# Altium schematic sheet Output.SchDoc
size A; SheetNumber: 9; SheetTotal: 9
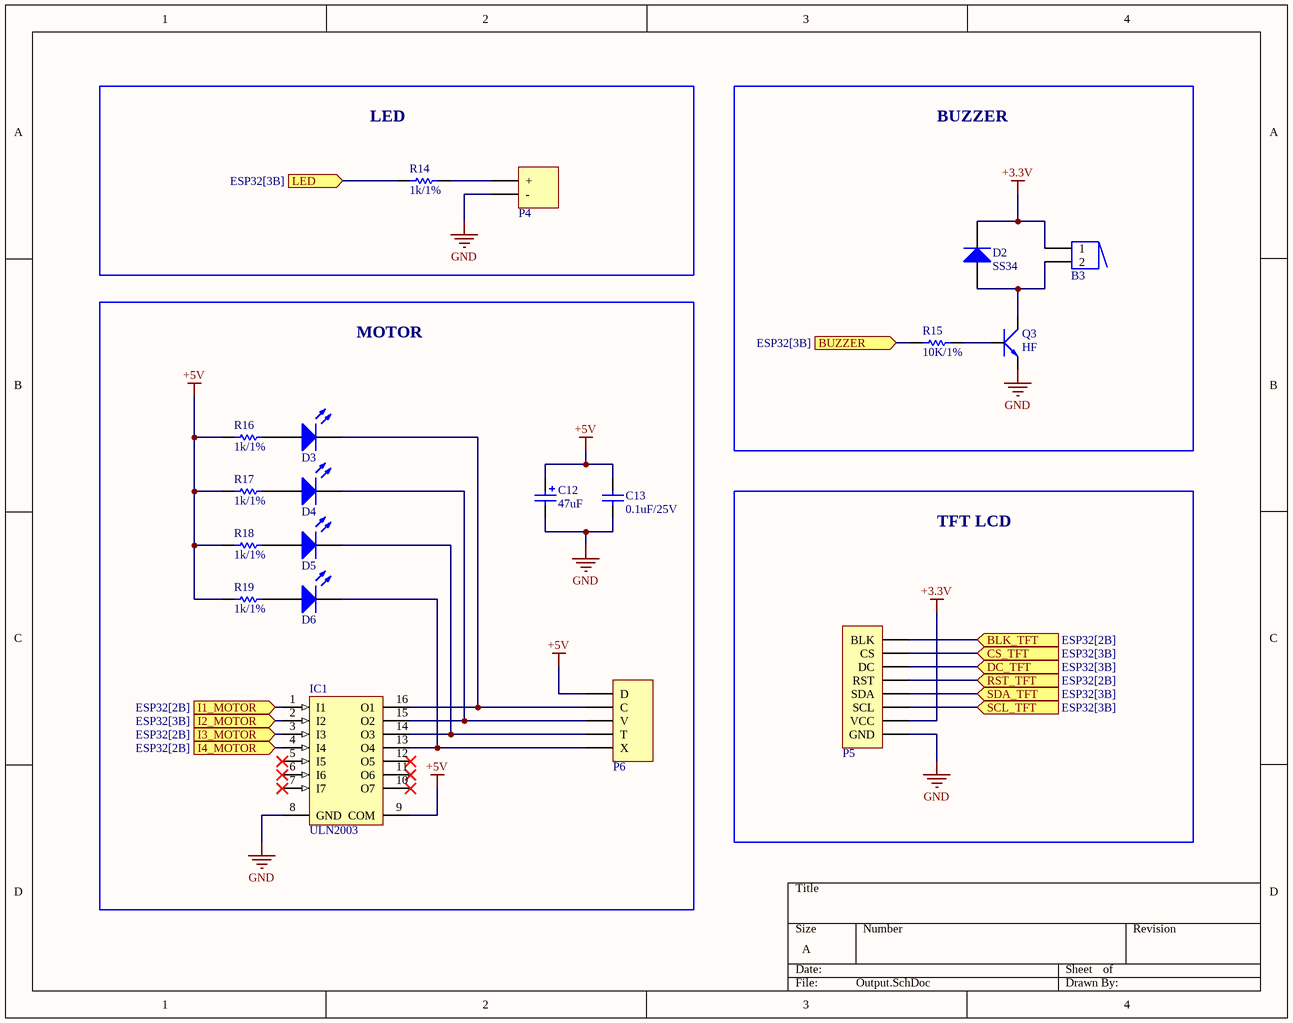
[diagram p0: Output.SchDoc]

## Parts
B3  Buzzer  [BUZZER]  (value not drawn)
C12  value 47uF  [CP1/2]  (hidden comment: Cap Pol)
C13  value 0.1uF/25V  [CAP-SM-0805]  (hidden comment: Cap Non-Pol SMD)
D2  SS34  [DIODE SMA]
D3  LED SMD  [LED_0805_Blue]  (value not drawn)
D4  LED SMD  [LED_0805_Blue]  (value not drawn)
D5  LED SMD  [LED_0805_Blue]  (value not drawn)
D6  LED SMD  [LED_0805_Blue]  (value not drawn)
IC1  ULN2003  [SOP 16]
P4  Header 2  [JP2]  (value not drawn)
P5  Header 8  [JP8]  (value not drawn)
P6  Header 5  [JP5]  (value not drawn)
Q3  HF  [SOT-23]
R14  value 1k/1%  [RES-SM-0805]  (hidden comment: RESISTOR SMD)
R15  value 10K/1%  [RES-SM-0805]  (hidden comment: RESISTOR SMD)
R16  value 1k/1%  [RES-SM-0805]  (hidden comment: RESISTOR SMD)
R17  value 1k/1%  [RES-SM-0805]  (hidden comment: RESISTOR SMD)
R18  value 1k/1%  [RES-SM-0805]  (hidden comment: RESISTOR SMD)
R19  value 1k/1%  [RES-SM-0805]  (hidden comment: RESISTOR SMD)

## Blocks framed on the sheet
LED: P4 R14
BUZZER: B3 D2 Q3 R15
MOTOR: C12 C13 D3-D6 IC1 P6 R16-R19
TFT LCD: P5

## Ports
BLK_TFT (in, see ESP32[2B]), BUZZER (in, see ESP32[3B]), CS_TFT (in, see ESP32[3B]), DC_TFT (in, see ESP32[3B]), I1_MOTOR (in, see ESP32[2B]), I2_MOTOR (in, see ESP32[3B]), I3_MOTOR (in, see ESP32[2B]), I4_MOTOR (in, see ESP32[2B]), LED (in, see ESP32[3B]), RST_TFT (in, see ESP32[2B]), SCL_TFT (in, see ESP32[3B]), SDA_TFT (in, see ESP32[3B])

## Nets
+3.3V: B3.1 D2.2(K) P5.7(VCC)
+5V: C12.1 C13.2 IC1.9(COM) P6.1(D) R16.1 R17.1 R18.1 R19.1
GND: C12.2 C13.1 IC1.8(GND) P4.2(-) P5.8(GND) Q3.2(E)
BLK_TFT: P5.1(BLK) ; port BLK_TFT
BUZZER: R15.1 ; port BUZZER
CS_TFT: P5.2(CS) ; port CS_TFT
DC_TFT: P5.3(DC) ; port DC_TFT
I1_MOTOR: IC1.1(I1) ; port I1_MOTOR
I2_MOTOR: IC1.2(I2) ; port I2_MOTOR
I3_MOTOR: IC1.3(I3) ; port I3_MOTOR
I4_MOTOR: IC1.4(I4) ; port I4_MOTOR
LED: R14.1 ; port LED
RST_TFT: P5.4(RST) ; port RST_TFT
SCL_TFT: P5.6(SCL) ; port SCL_TFT
SDA_TFT: P5.5(SDA) ; port SDA_TFT
NetB3_2: B3.2 D2.1(A) Q3.3(C)
NetD3_1: D3.1(A) R16.2
NetD3_2: D3.2(K) IC1.16(O1) P6.2(C)
NetD4_1: D4.1(A) R17.2
NetD4_2: D4.2(K) IC1.15(O2) P6.3(V)
NetD5_1: D5.1(A) R18.2
NetD5_2: D5.2(K) IC1.14(O3) P6.4(T)
NetD6_1: D6.1(A) R19.2
NetD6_2: D6.2(K) IC1.13(O4) P6.5(X)
NetP4_1: P4.1(+) R14.2
NetQ3_1: Q3.1(B) R15.2

Not connected (* = marked no-connect by the designer): IC1 5(I5)* 6(I6)* 7(I7)* 10(O7)* 11(O6)* 12(O5)*

## Library data of the parts
C12 = Cap Pol: Polarized Capacitor (Radial)
C13 = Cap Non-Pol SMD: Capacitor
D2 = Diode SS34 ( 1N5822 ): Dán; Don_Vi: Con; Ma_Hang: MH002104; Ten_Linh_Kien: Diode SS34 3A 40V SMA ( 1N5822 SS34A); Kieu_Chan: *; Chung_Loai: Dán
D3-D6 = LED SMD: LED
IC1 = ULN2003A SMD: Dán; Ten_Linh_Kien: ULN2003 SOP16; Don_Vi: Con; Ma_Hang: MH002408; Ghi_Chu: *; Chung_Loai: Dán; Kieu_Chan: *
P4 = Header 2: Header, 2-Pin; LatestRevisionDate: 17-Jul-2002; LatestRevisionNote: Re-released for DXP Platform.; Publisher: Altium Limited
P5 = Header 8: Header, 8-Pin; LatestRevisionDate: 17-Jul-2002; LatestRevisionNote: Re-released for DXP Platform.; Publisher: Altium Limited
P6 = Header 5: Header, 5-Pin; LatestRevisionDate: 17-Jul-2002; LatestRevisionNote: Re-released for DXP Platform.; Publisher: Altium Limited
Q3 = Trans C1815 HF SMD: SOT-23; Value: C9014
R14-R19 = RESISTOR SMD: Resistor